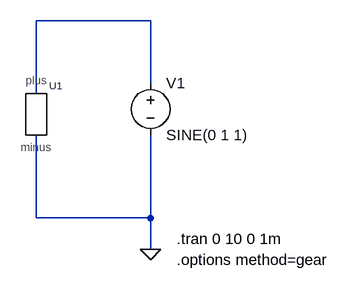
[diagram p0: schematic memristor_sine.asc]
memristor_sine.asc, the LTspice schematic file:
Version 4.1
SHEET 1 880 680
WIRE 272 0 96 0
WIRE 272 96 272 0
WIRE 96 112 96 0
WIRE 96 304 96 176
WIRE 272 304 272 176
WIRE 272 304 96 304
WIRE 272 352 272 304
FLAG 272 352 0
SYMBOL memristor 96 144 R0
SYMATTR InstName U1
SYMBOL voltage 272 80 R0
WINDOW 123 0 0 Left 0
WINDOW 39 0 0 Left 0
SYMATTR InstName V1
SYMATTR Value SINE(0 1 1)
TEXT 312 336 Left 2 !.tran 0 10 0 1m
TEXT 312 368 Left 2 !.options method=gear

The netlist it stands for:
* memristor_sine.asc
X§U1 N001 0 memristorR1  ; pins plus minus
V1 N001 0 SINE(0 1 1)
.tran 0 10 0 1m
.options method=gear
.lib memristor.sub
.backanno
.end